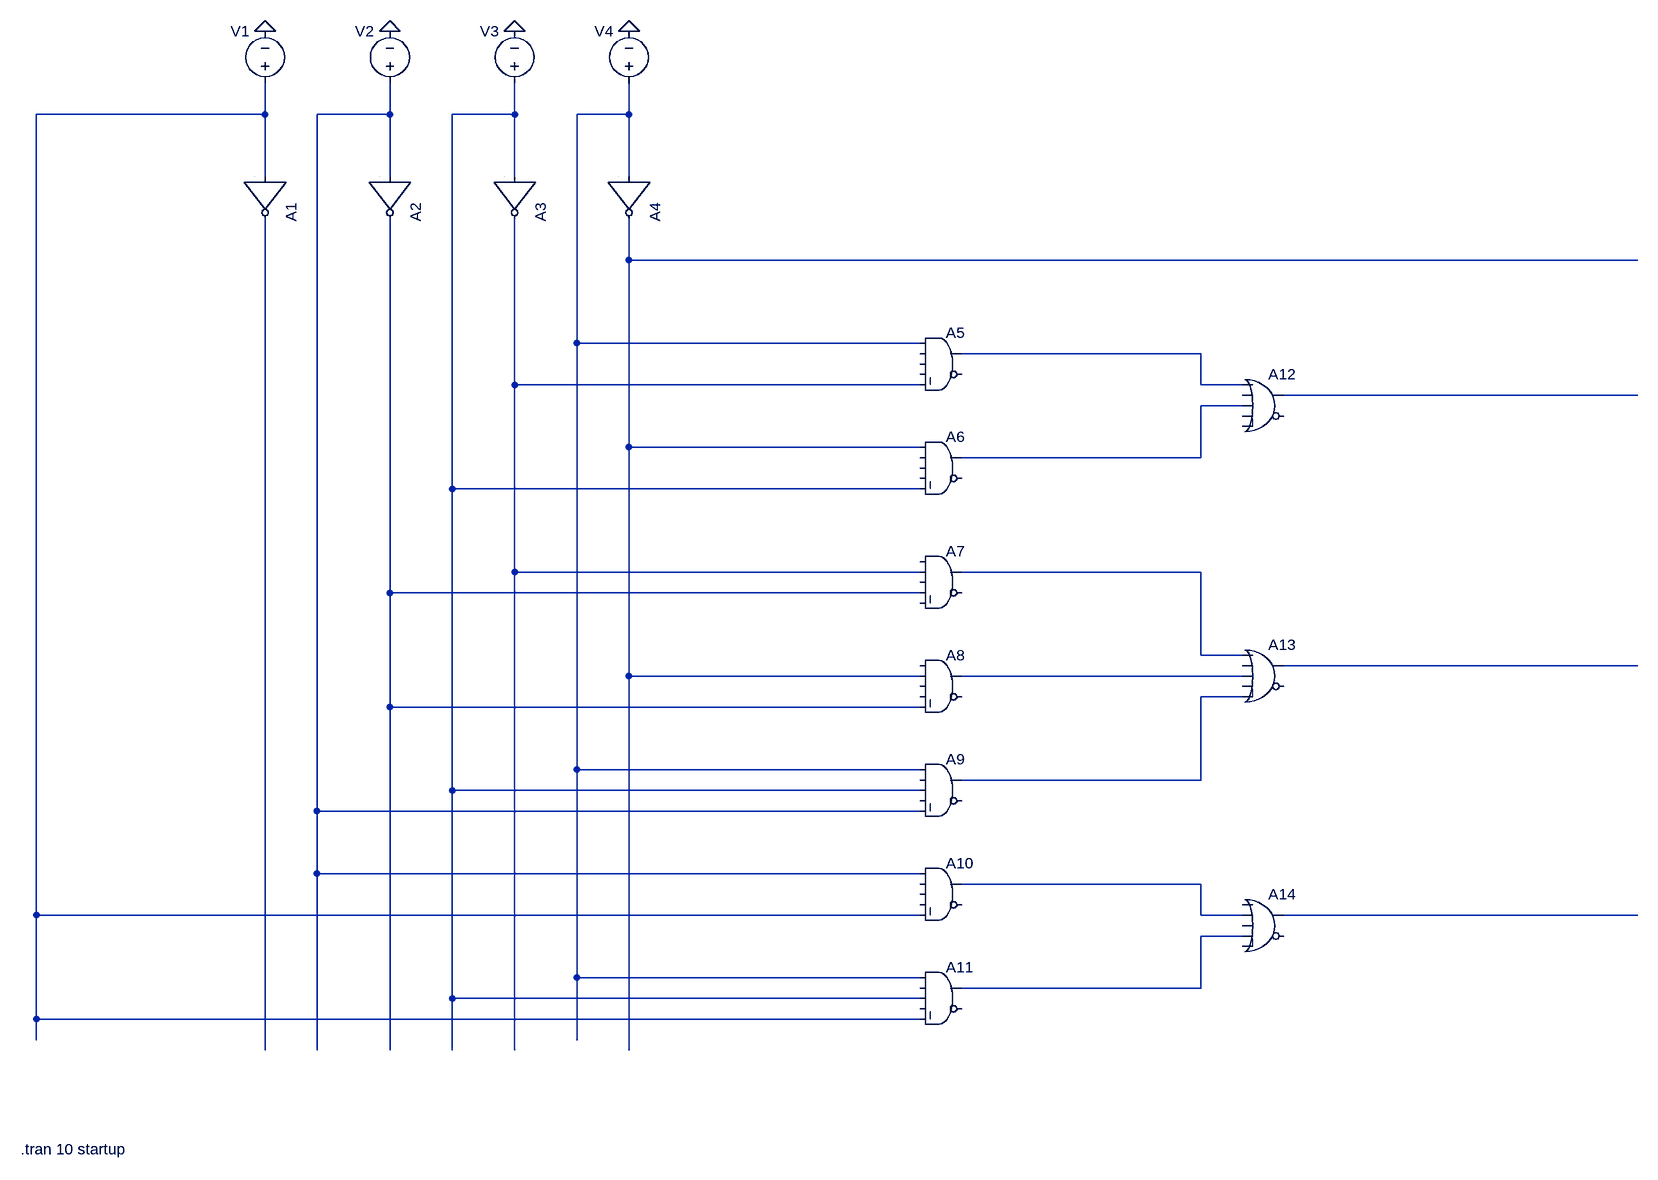
[diagram p0: schematic Excess3_BCD.asc]
Excess3_BCD.asc, the LTspice schematic file:
Version 4.1
SHEET 1 2004 1416
WIRE -112 -192 -112 -240
WIRE -112 -192 -464 -192
WIRE 80 -192 80 -240
WIRE 80 -192 -32 -192
WIRE 272 -192 272 -240
WIRE 272 -192 176 -192
WIRE 448 -192 448 -240
WIRE 448 -192 368 -192
WIRE -112 -96 -112 -192
WIRE 80 -96 80 -192
WIRE 272 -96 272 -192
WIRE 448 -96 448 -192
WIRE 448 32 448 -32
WIRE 2000 32 448 32
WIRE 368 160 368 -192
WIRE 896 160 368 160
WIRE 1328 176 960 176
WIRE 272 224 272 -32
WIRE 896 224 272 224
WIRE 1328 224 1328 176
WIRE 1392 224 1328 224
WIRE 2000 240 1456 240
WIRE 1392 256 1328 256
WIRE 448 320 448 32
WIRE 896 320 448 320
WIRE 1328 336 1328 256
WIRE 1328 336 960 336
WIRE 176 384 176 -192
WIRE 896 384 176 384
WIRE 272 512 272 224
WIRE 896 512 272 512
WIRE 1328 512 960 512
WIRE 80 544 80 -32
WIRE 896 544 80 544
WIRE 1328 640 1328 512
WIRE 1392 640 1328 640
WIRE 2000 656 1456 656
WIRE 448 672 448 320
WIRE 896 672 448 672
WIRE 1392 672 960 672
WIRE 1392 704 1328 704
WIRE 80 720 80 544
WIRE 896 720 80 720
WIRE 368 816 368 160
WIRE 896 816 368 816
WIRE 1328 832 1328 704
WIRE 1328 832 960 832
WIRE 176 848 176 384
WIRE 896 848 176 848
WIRE -32 880 -32 -192
WIRE 896 880 -32 880
WIRE -32 976 -32 880
WIRE 896 976 -32 976
WIRE 1328 992 960 992
WIRE -464 1040 -464 -192
WIRE 896 1040 -464 1040
WIRE 1328 1040 1328 992
WIRE 1392 1040 1328 1040
WIRE 2000 1040 1456 1040
WIRE 1392 1072 1328 1072
WIRE 368 1136 368 816
WIRE 896 1136 368 1136
WIRE 1328 1152 1328 1072
WIRE 1328 1152 960 1152
WIRE 176 1168 176 848
WIRE 896 1168 176 1168
WIRE -464 1200 -464 1040
WIRE 896 1200 -464 1200
WIRE -464 1232 -464 1200
WIRE 368 1232 368 1136
WIRE -112 1248 -112 -32
WIRE -32 1248 -32 976
WIRE 80 1248 80 720
WIRE 176 1248 176 1168
WIRE 272 1248 272 512
WIRE 448 1248 448 672
FLAG -112 -320 0
FLAG 80 -320 0
FLAG 272 -320 0
FLAG 448 -320 0
SYMBOL Digital\\inv -48 -96 R90
SYMATTR InstName A1
SYMBOL Digital\\inv 144 -96 R90
SYMATTR InstName A2
SYMBOL Digital\\inv 336 -96 R90
SYMATTR InstName A3
SYMBOL Digital\\inv 512 -96 R90
SYMATTR InstName A4
SYMBOL Digital\\and 928 128 R0
SYMATTR InstName A5
SYMBOL Digital\\and 928 288 R0
SYMATTR InstName A6
SYMBOL Digital\\and 928 464 R0
SYMATTR InstName A7
SYMBOL Digital\\and 928 624 R0
SYMATTR InstName A8
SYMBOL Digital\\and 928 784 R0
SYMATTR InstName A9
SYMBOL Digital\\and 928 944 R0
SYMATTR InstName A10
SYMBOL Digital\\and 928 1104 R0
SYMATTR InstName A11
SYMBOL Digital\\or 1424 192 R0
SYMATTR InstName A12
SYMBOL Digital\\or 1424 608 R0
SYMATTR InstName A13
SYMBOL Digital\\or 1424 992 R0
SYMATTR InstName A14
SYMBOL voltage -112 -224 R180
WINDOW 0 24 96 Left 2
WINDOW 3 24 68 Invisible 2
WINDOW 123 0 0 Left 0
WINDOW 39 0 0 Left 0
SYMATTR InstName V1
SYMATTR Value PWL(0 0 5 0 5.001 1 10 1)
SYMBOL voltage 80 -224 R180
WINDOW 0 24 96 Left 2
WINDOW 3 24 68 Invisible 2
WINDOW 123 0 0 Left 0
WINDOW 39 0 0 Left 0
SYMATTR InstName V2
SYMATTR Value PWL(0 0 1 0 1.001 1 5 1 5.001 0 9 0 9.001 1 10 1)
SYMBOL voltage 272 -224 R180
WINDOW 0 24 96 Left 2
WINDOW 3 24 68 Invisible 2
WINDOW 123 0 0 Left 0
WINDOW 39 0 0 Left 0
SYMATTR InstName V3
SYMATTR Value PWL(0 1 1 1 1.001 0 3 0 3.001 1 5 1 5.001 0 7 0 7.001 1 9 1 9.001 0 10 0)
SYMBOL voltage 448 -224 R180
WINDOW 0 24 96 Left 2
WINDOW 3 24 68 Invisible 2
WINDOW 123 0 0 Left 0
WINDOW 39 0 0 Left 0
SYMATTR InstName V4
SYMATTR Value PWL(0 1 1 1 1.001 0 2 0 2.001 1 3 1 3.001 0 4 0 4.001 1 5 1 5.001 0 6 0 6.001 1 7 1 7.001 0 8 0 8.001 1 9 1 9.001 0 10 0)
TEXT -488 1400 Left 2 !.tran 10 startup

The netlist it stands for:
* Excess3_BCD.asc
A1 N001 0 0 0 0 N018 0 0 BUF
A2 N002 0 0 0 0 N011 0 0 BUF
A3 N003 0 0 0 0 N007 0 0 BUF
A4 N004 0 0 0 0 N005 0 0 BUF
A5 N004 0 0 0 N007 0 N006 0 AND
A6 N005 0 0 0 N003 0 N009 0 AND
A7 0 N007 0 N011 0 0 N010 0 AND
A8 0 N005 0 0 N011 0 N013 0 AND
A9 N004 0 N003 0 N002 0 N014 0 AND
A10 N002 0 0 0 N001 0 N015 0 AND
A11 N004 0 N003 0 N001 0 N017 0 AND
A12 N006 0 N009 0 0 0 N008 0 OR
A13 N010 0 N013 0 N014 0 N012 0 OR
A14 0 N015 0 N017 0 0 N016 0 OR
V1 N001 0 PWL(0 0 5 0 5.001 1 10 1)
V2 N002 0 PWL(0 0 1 0 1.001 1 5 1 5.001 0 9 0 9.001 1 10 1)
V3 N003 0 PWL(0 1 1 1 1.001 0 3 0 3.001 1 5 1 5.001 0 7 0 7.001 1 9 1 9.001 0 10 0)
V4 N004 0 PWL(0 1 1 1 1.001 0 2 0 2.001 1 3 1 3.001 0 4 0 4.001 1 5 1 5.001 0 6 0 6.001 1 7 1 7.001 0 8 0 8.001 1 9 1 9.001 0 10 0)
.tran 10 startup
.backanno
.end